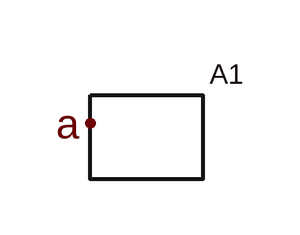
[diagram p0: schematic adevice_open_pin_three.asc]
adevice_open_pin_three.asc, the LTspice schematic file:
Version 4
SHEET 1 880 680
FLAG 64 64 a
SYMBOL a3 96 64 R0
SYMATTR InstName A1

The netlist it stands for:
* adevice_open_pin_three.asc
A1 a 0 0 0 0 0 0 0 AND
.backanno
.end